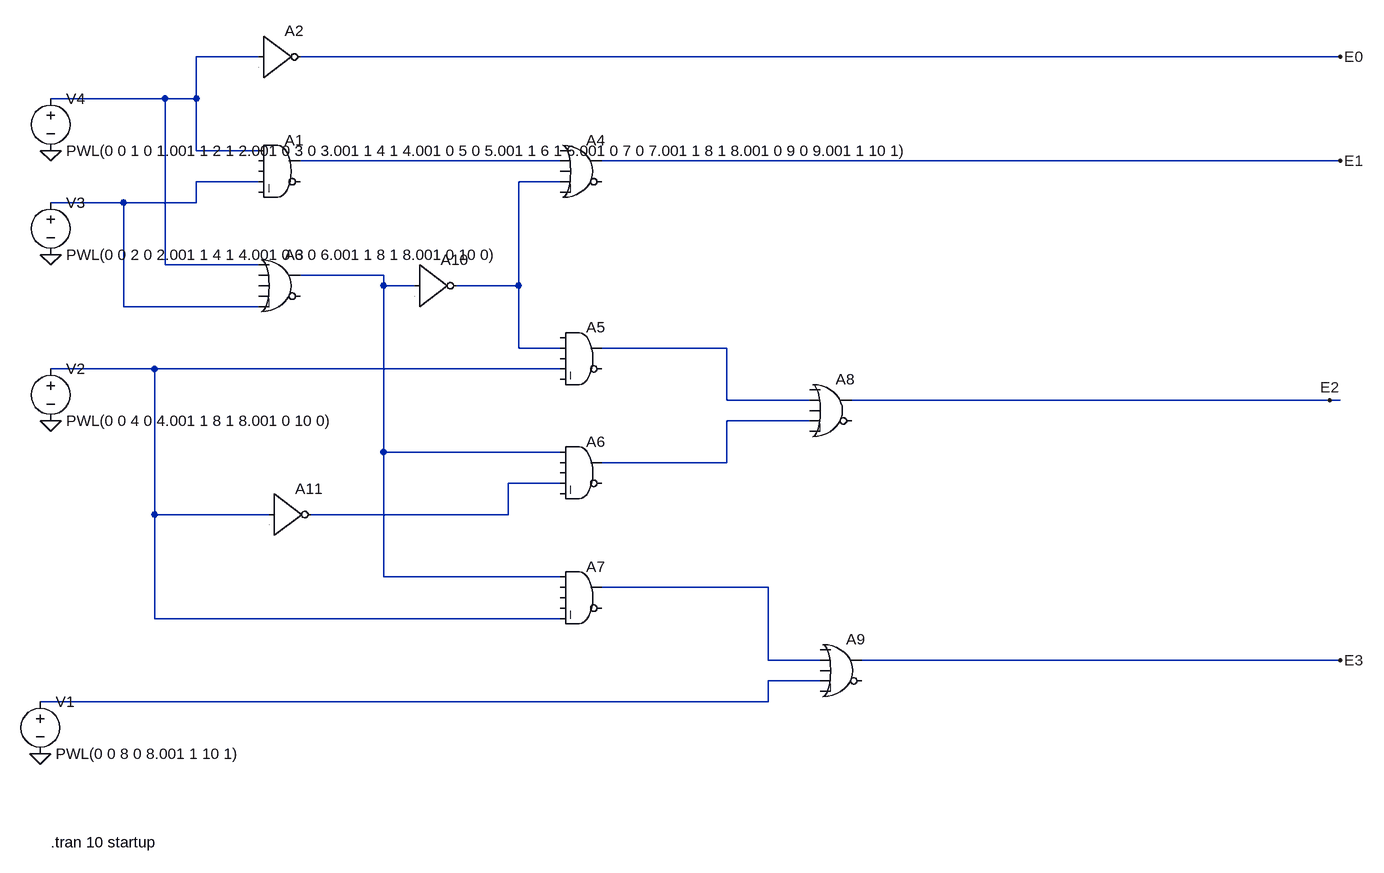
[diagram p0: schematic BCD_excess3.asc]
BCD_excess3.asc, the LTspice schematic file:
Version 4.1
SHEET 1 1760 1000
WIRE 48 -224 -48 -224
WIRE 1712 -224 112 -224
WIRE -96 -160 -272 -160
WIRE -48 -160 -48 -224
WIRE -48 -160 -96 -160
WIRE -48 -80 -48 -160
WIRE 48 -80 -48 -80
WIRE 512 -64 112 -64
WIRE 1712 -64 576 -64
WIRE 48 -32 -48 -32
WIRE 512 -32 448 -32
WIRE -160 0 -272 0
WIRE -48 0 -48 -32
WIRE -48 0 -160 0
WIRE -96 96 -96 -160
WIRE 48 96 -96 96
WIRE 240 112 112 112
WIRE 240 128 240 112
WIRE 288 128 240 128
WIRE 448 128 448 -32
WIRE 448 128 352 128
WIRE -160 160 -160 0
WIRE 48 160 -160 160
WIRE 448 224 448 128
WIRE 512 224 448 224
WIRE 768 224 576 224
WIRE -112 256 -272 256
WIRE 512 256 -112 256
WIRE 768 304 768 224
WIRE 896 304 768 304
WIRE 1696 304 960 304
WIRE 1712 304 1696 304
WIRE 896 336 768 336
WIRE 240 384 240 128
WIRE 512 384 240 384
WIRE 768 400 768 336
WIRE 768 400 576 400
WIRE 512 432 432 432
WIRE -112 480 -112 256
WIRE 64 480 -112 480
WIRE 432 480 432 432
WIRE 432 480 128 480
WIRE 240 576 240 384
WIRE 512 576 240 576
WIRE 832 592 576 592
WIRE -112 640 -112 480
WIRE 512 640 -112 640
WIRE 832 704 832 592
WIRE 912 704 832 704
WIRE 1712 704 976 704
WIRE 912 736 832 736
WIRE 832 768 832 736
WIRE 832 768 -288 768
FLAG -272 -80 0
FLAG -272 80 0
FLAG -272 336 0
FLAG -288 848 0
FLAG 1712 704 E3
FLAG 1696 304 E2
FLAG 1712 -64 E1
FLAG 1712 -224 E0
SYMBOL Digital\\and 80 -112 R0
SYMATTR InstName A1
SYMBOL Digital\\inv 48 -288 R0
SYMATTR InstName A2
SYMBOL Digital\\or 80 64 R0
SYMATTR InstName A3
SYMBOL Digital\\or 544 -112 R0
SYMATTR InstName A4
SYMBOL Digital\\and 544 176 R0
SYMATTR InstName A5
SYMBOL Digital\\and 544 352 R0
SYMATTR InstName A6
SYMBOL Digital\\and 544 544 R0
SYMATTR InstName A7
SYMBOL Digital\\or 928 256 R0
SYMATTR InstName A8
SYMBOL Digital\\or 944 656 R0
SYMATTR InstName A9
SYMBOL Digital\\inv 288 64 R0
SYMATTR InstName A10
SYMBOL Digital\\inv 64 416 R0
SYMATTR InstName A11
SYMBOL voltage -288 752 R0
WINDOW 123 0 0 Left 0
WINDOW 39 0 0 Left 0
SYMATTR InstName V1
SYMATTR Value PWL(0 0 8 0 8.001 1 10 1)
SYMBOL voltage -272 240 R0
WINDOW 123 0 0 Left 0
WINDOW 39 0 0 Left 0
SYMATTR InstName V2
SYMATTR Value PWL(0 0 4 0 4.001 1 8 1 8.001 0 10 0)
SYMBOL voltage -272 -16 R0
WINDOW 123 0 0 Left 0
WINDOW 39 0 0 Left 0
SYMATTR InstName V3
SYMATTR Value PWL(0 0 2 0 2.001 1 4 1 4.001 0 6 0 6.001 1 8 1 8.001 0 10 0)
SYMBOL voltage -272 -176 R0
WINDOW 123 0 0 Left 0
WINDOW 39 0 0 Left 0
SYMATTR InstName V4
SYMATTR Value PWL(0 0 1 0 1.001 1 2 1 2.001 0 3 0 3.001 1 4 1 4.001 0 5 0 5.001 1 6 1 6.001 0 7 0 7.001 1 8 1 8.001 0 9 0 9.001 1 10 1)
TEXT -272 984 Left 2 !.tran 10 startup

The netlist it stands for:
* BCD_excess3.asc
A1 N001 0 0 N003 0 0 N002 0 AND
A2 N001 0 0 0 0 E0 0 0 BUF
A3 N001 0 0 0 N003 0 N005 0 OR
A4 0 N002 0 N004 0 0 E1 0 OR
A5 0 N004 0 N007 0 0 N006 0 AND
A6 N005 0 0 N009 0 0 N008 0 AND
A7 N005 0 0 0 N007 0 N010 0 AND
A8 0 N006 0 N008 0 0 E2 0 OR
A9 0 N010 0 N011 0 0 E3 0 OR
A10 N005 0 0 0 0 N004 0 0 BUF
A11 N007 0 0 0 0 N009 0 0 BUF
V1 N011 0 PWL(0 0 8 0 8.001 1 10 1)
V2 N007 0 PWL(0 0 4 0 4.001 1 8 1 8.001 0 10 0)
V3 N003 0 PWL(0 0 2 0 2.001 1 4 1 4.001 0 6 0 6.001 1 8 1 8.001 0 10 0)
V4 N001 0 PWL(0 0 1 0 1.001 1 2 1 2.001 0 3 0 3.001 1 4 1 4.001 0 5 0 5.001 1 6 1 6.001 0 7 0 7.001 1 8 1 8.001 0 9 0 9.001 1 10 1)
.tran 10 startup
.backanno
.end